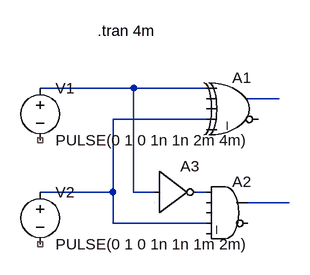
[diagram p0: schematic HS.asc]
HS.asc, the LTspice schematic file:
Version 4.1
SHEET 1 880 680
WIRE 224 48 80 48
WIRE 336 48 224 48
WIRE 448 64 400 64
WIRE 336 96 192 96
WIRE 192 208 192 96
WIRE 192 208 80 208
WIRE 224 208 224 48
WIRE 256 208 224 208
WIRE 336 208 320 208
WIRE 464 224 400 224
WIRE 192 256 192 208
WIRE 336 256 192 256
SYMBOL voltage 80 32 R0
WINDOW 123 0 0 Left 0
WINDOW 39 0 0 Left 0
SYMATTR InstName V1
SYMATTR Value PULSE(0 1 0 1n 1n 2m 4m)
SYMBOL voltage 80 192 R0
WINDOW 123 0 0 Left 0
WINDOW 39 0 0 Left 0
SYMATTR InstName V2
SYMATTR Value PULSE(0 1 0 1n 1n 1m 2m)
SYMBOL Digital\\xor 384 16 R0
SYMATTR InstName A1
SYMBOL Digital\\and 368 176 R0
SYMATTR InstName A2
SYMBOL Digital\\inv 256 144 R0
SYMATTR InstName A3
TEXT 168 -40 Left 2 !.tran 4m

The netlist it stands for:
* HS.asc
V1 N001 NC_01 PULSE(0 1 0 1n 1n 2m 4m)
V2 N003 NC_02 PULSE(0 1 0 1n 1n 1m 2m)
A1 N001 0 0 N003 0 0 N002 0 XOR
A2 N004 0 0 N003 0 0 N005 0 AND
A3 N001 0 0 0 0 N004 0 0 BUF
.tran 4m
.backanno
.end